# Altium schematic sheet Connector_Section.SchDoc
size A4; DocumentNumber: 7; SheetNumber: 7; SheetTotal: 7
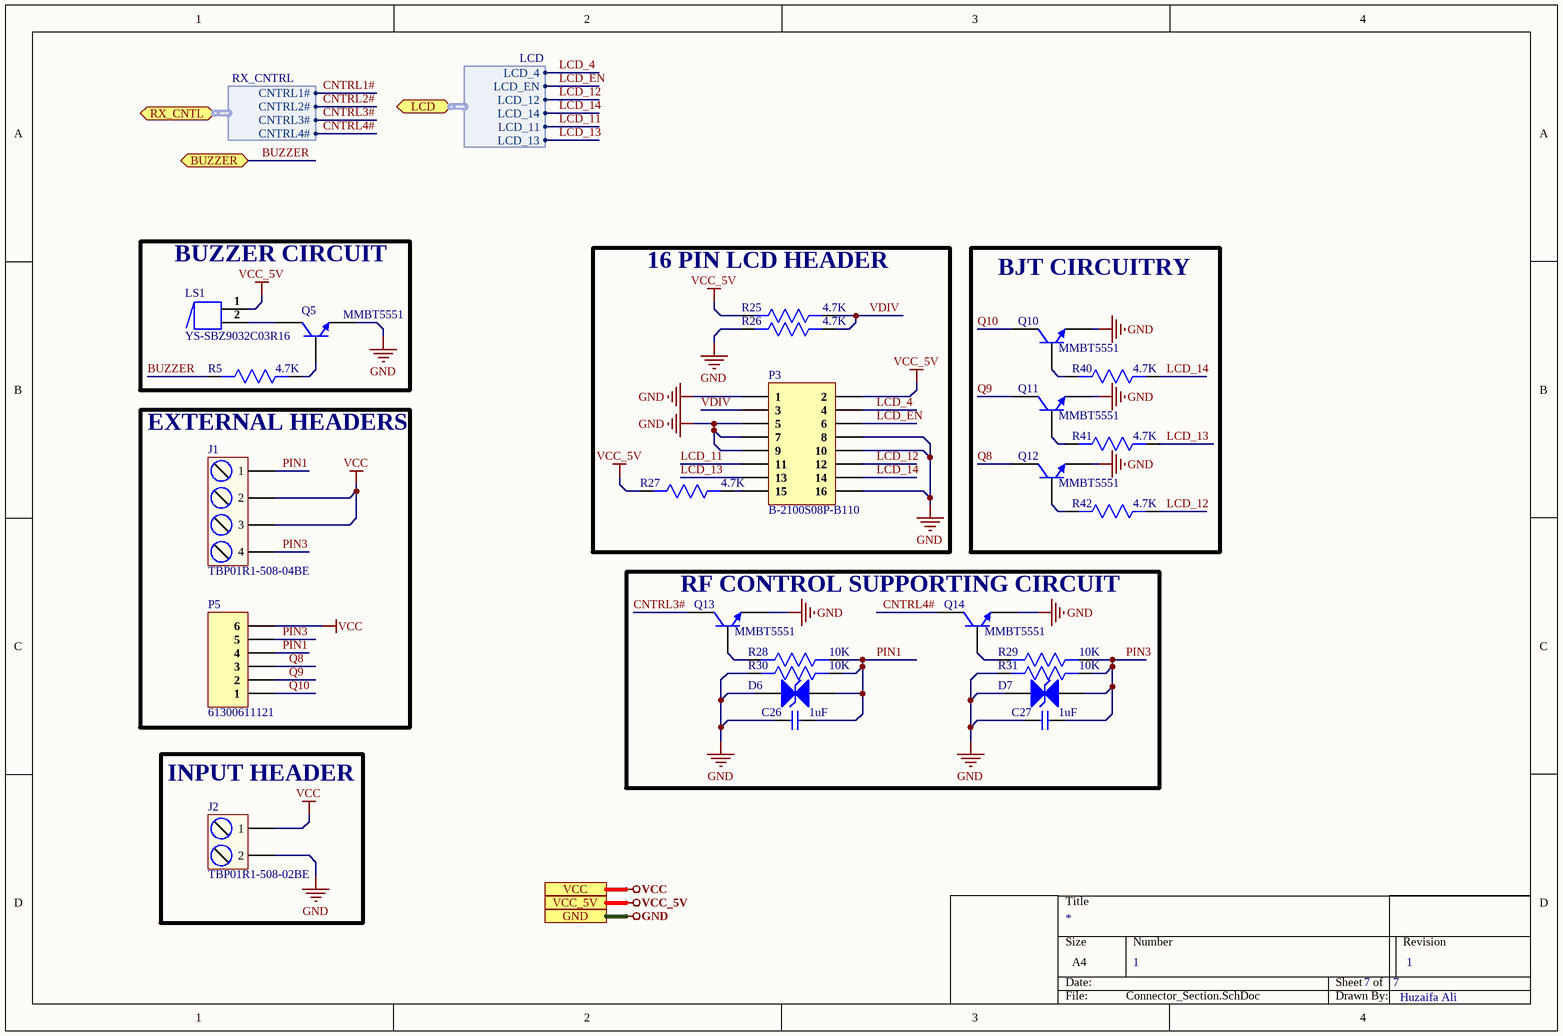
[diagram p0: Connector_Section.SchDoc]

## Parts
C26  1uF  [Cap0603]
C27  1uF  [Cap0603]
D6  SMAJ5.0CA  [SMA]  (value not drawn)
D7  SMAJ5.0CA  [SMA]  (value not drawn)
J1  TBP01R1-508-04BE  [TBP01R1-508-04BE]
J2  TBP01R1-508-02BE  [TBP01R1-508-02BE]
LS1  YS-SBZ9032C03R16  [YS-SBZ9032C03R16]
P3  B-2100S08P-B110  [B-2100S08P-B110]
P5  61300611121  [HDR1X6]
Q5  MMBT5551  [SOT23-3]
Q10  MMBT5551  [SOT23-3]
Q11  MMBT5551  [SOT23-3]
Q12  MMBT5551  [SOT23-3]
Q13  MMBT5551  [SOT23-3]
Q14  MMBT5551  [SOT23-3]
R5  4.7K  [Res-0603]
R25  4.7K  [Res0603]
R26  4.7K  [Res0603]
R27  4.7K  [Res0603]
R28  10K  [Res0603]
R29  10K  [Res0603]
R30  10K  [Res0603]
R31  10K  [Res0603]
R40  4.7K  [Res0603]
R41  4.7K  [Res0603]
R42  4.7K  [Res0603]

## Blocks framed on the sheet
BUZZER CIRCUIT: LS1 Q5 R5
16 PIN LCD HEADER: P3 R25-R27
BJT CIRCUITRY: Q10-Q12 R40-R42
EXTERNAL HEADERS: J1 P5
RF CONTROL SUPPORTING CIRCUIT: C26 C27 D6 D7 Q13 Q14 R28-R31
INPUT HEADER: J2

## Ports
BUZZER (bidir), GND, LCD (bidir, harness LCD), RX_CNTL (bidir, harness RX_CNTRL), VCC, VCC_5V

## Harnesses
RX_CNTRL: CNTRL1#, CNTRL2#, CNTRL3#, CNTRL4#
LCD: LCD_4, LCD_EN, LCD_12, LCD_14, LCD_11, LCD_13

## Nets
GND: C26.1 C27.1 D6.1(A) D7.1(A) J2.2 P3.1 P3.5 P3.7 P3.8 P3.9 P3.10 P3.16 Q5.2(E) Q10.2(E) Q11.2(E) Q12.2(E) Q13.2(E) Q14.2(E) R26.2 R30.2 R31.2 ; port GND
VCC: J1.2 J1.3 J2.1 P5.6 ; port VCC
VCC_5V: LS1.1 P3.2 R25.2 R27.2 ; port VCC_5V
BUZZER: R5.2 ; port BUZZER
CNTRL1#: port RX_CNTL.CNTRL1#
CNTRL2#: port RX_CNTL.CNTRL2#
CNTRL3#: Q13.3(C) ; port RX_CNTL.CNTRL3#
CNTRL4#: Q14.3(C) ; port RX_CNTL.CNTRL4#
LCD_4: P3.4 ; port LCD.LCD_4
LCD_11: P3.11 ; port LCD.LCD_11
LCD_12: P3.12 R42.1 ; port LCD.LCD_12
LCD_13: P3.13 R41.1 ; port LCD.LCD_13
LCD_14: P3.14 R40.1 ; port LCD.LCD_14
LCD_EN: P3.6 ; port LCD.LCD_EN
PIN1: C26.2 D6.2(A) J1.1 P5.4 R28.1 R30.1
PIN3: C27.2 D7.2(A) J1.4 P5.5 R29.1 R31.1
Q8: P5.3 Q12.3(C)
Q9: P5.2 Q11.3(C)
Q10: P5.1 Q10.3(C)
VDIV: P3.3 R25.1 R26.1
NetLS1_2: LS1.2 Q5.3(C)
NetP3_15: P3.15 R27.1
NetQ5_1: Q5.1(B) R5.1
NetQ10_1: Q10.1(B) R40.2
NetQ11_1: Q11.1(B) R41.2
NetQ12_1: Q12.1(B) R42.2
NetQ13_1: Q13.1(B) R28.2
NetQ14_1: Q14.1(B) R29.2

## Notes on the sheet
- 1
- Huzaifa Ali

## Library data of the parts
C26 C27 = CL10A105KA8NNNC: CAP CER 1UF 25V X5R 0603; Manufacturer: Sams; Tolerance: 10%; Supplier 1: Digi-Key; Manufacturer Part Number: CL10A105KA8NNNC; Stock 1: 2768758; Pricing 1: 1=0.1, 10=0.036, 50=0.0198, 100=0.0161, 500=0.01152, 1000=0.00904 (USD); Mount: Surface Mount; Case/Package: 0603; Min Operating Temperature: -55°C; Max Operating Temperature: 85°C; Capacitance: 1uF; Dielectric: X5R; Voltage Rating (DC): 25V; Voltage: 25V; Length: 1.6mm; Height: 0.8mm; Depth: 0.8mm; Lead Free: Lead Free; Supplier Part Number 1: 1276-1102-1-ND
D6 D7 = SMAJ5.0CA: 43.5A 9.2V 6.4V 5V Bi-Directional SMA(DO-214AC) TVS ROHS; Manufacturer: Bourns; Breakdown Voltage: 7V; Polarity: Bidirectional; Peak Pulse Power: 400W; Test Current: 10mA; Element Configuration: Single; Max Surge Current: 40A; Max Reverse Leakage Current: 1.6mA; Number of Channels: 1; Power Line Protection: No; Diode Type: ZENER; ESD Protection: Yes; Supplier 1: RSComponents; Manufacturer Part Number: SMAJ5.0CA; RoHS: Yes; Category: TVS Diodes; Stock 1: 4825; Pricing 1: 5000=0.16400, 10000=0.16000, 15000=0.15600 (GBP); Mount: Surface Mount; Case/Package: DO-214AC; Number of Pins: 2; Contact Plating: Tin; Min Operating Temperature: -55°C; Max Operating Temperature: 150°C; Reverse Standoff Voltage: 5V; Clamping Voltage: 9.2V; Direction: Bidirectional; Packaging: Tape and Reel; Min Breakdown Voltage: 6.4V; Peak Pulse Current: 43.5A; Package Quantity: 1; Operating Supply Voltage: 5V; Max Power Dissipation: 400W; Termination: SMD/SMT; Reverse Breakdown Voltage: 6.4V; Max Breakdown Voltage: 7V; Number of Elements: 1; Leakage Current: 1.6mA; Number of Bidirectional Channels: 1; Resistor Type: Zener; Series: SMAJ; Radiation Hardening: No; RoHS Compliant: Yes; REACH SVHC: No SVHC; ComponentLink1URL: https://datasheet.ciiva.com/11336/smaj-11336795.pdf?src-supplier=Avnet; ComponentLink1Description: https://datasheet.ciiva.com/11336/smaj-11336795.pdf?src-supplier=Avnet; ComponentLink2URL: https://datasheet.ciiva.com/3022/smaj-3022286.pdf?src-supplier=Avnet; ComponentLink2Description: https://datasheet.ciiva.com/3022/smaj-3022286.pdf?src-supplier=Avnet; ComponentLink3URL: https://datasheet.ciiva.com/334/smaj-334523.pdf?src-supplier=Digi-Key; ComponentLink3Description: https://datasheet.ciiva.com/334/smaj-334523.pdf?src-supplier=Digi-Key; ComponentLink4URL: https://datasheet.ciiva.com/334/smaj-334524.pdf?src-supplier=Digi-Key; ComponentLink4Description: https://datasheet.ciiva.com/334/smaj-334524.pdf?src-supplier=Digi-Key; ComponentLink5URL: https://datasheet.ciiva.com/334/smaj-334522.pdf?src-supplier=Digi-Key; ComponentLink5Description: https://datasheet.ciiva.com/334/smaj-334522.pdf?src-supplier=Digi-Key; ComponentLink6URL: https://datasheet.ciiva.com/30090/smaj-30090141.pdf?src-supplier=Onlinecomponents.com; ComponentLink6Description: https://datasheet.ciiva.com/30090/smaj-30090141.pdf?src-supplier=Onlinecomponents.com; ComponentLink7URL: https://datasheet.ciiva.com/17413/smaj-17413550.pdf?; ComponentLink7Description: https://datasheet.ciiva.com/17413/smaj-17413550.pdf?; Supplier Part Number 1: 1742481
J1 = TBP01R1-508-04BE: TERMINAL BLOCK, PLUGGABLE, 5.08,; Manufacturer: CUI Devices; Supplier 1: Arrow Electronics; Manufacturer Part Number: TBP01R1-508-04BE; RoHS: Yes; Category: Terminal Blocks; Stock 1: 697; Pricing 1: 1=0.77380, 10=0.29040, 25=0.28750, 50=0.25070, 200=0.24820, 400=0.24580, 600=0.22570 (USD); Supplier Part Number 1: TBP01R1-508-04BE
J2 = TBP01R1-508-02BE: TERMINAL BLOCK, PLUGGABLE, 5.08,; Manufacturer: CUI Devices; Supplier 1: Arrow Electronics; Manufacturer Part Number: TBP01R1-508-02BE; RoHS: Yes; Category: Terminal Blocks; Stock 1: 1821; Pricing 1: 1=0.57450, 10=0.23530, 25=0.18730, 50=0.17170, 100=0.16040, 400=0.14010, 800=0.12060, 1200=0.11290 (USD); Supplier Part Number 1: TBP01R1-508-02BE
LS1 = YS-SBZ9032C03R16: NO 2700Hz 85dB @ 3V, 10cm 3V Φ9mm SMD,9x3.2mm Buzzers RoHS; Manufacturer: Fengming; Operating Voltage: 2 ~ 4V; Package: SMD,9x3.2mm; Frequency - Self Resonant: 2700Hz; Rated Voltage: 3V
P3 = B-2100S08P-B110: Straight 2.54mm 6mm -40℃~+105℃ 2 3mm 8 2.54mm Black Brass 2x4P 2.54mm Plugin,P=2.54mm Pin Headers; Manufacturer: Ckmtw(Shenzhen Cankemeng); Mounting Type: Straight; Insulation Height: 2.54mm; Length of Mating Pin: 6mm; Operating Temperature Range: -40℃~+105℃; Number of Rows: 2; Length of End Connection Pin: 3mm
P5 = 61300611121: CONN HEADER 6 POS 2.54; Manufacturer: Wurth Electronics; Current Rating: 3A; Voltage Rating: 250V; Number of Positions: 6; Gender: Male; Connector Type: Male Pin; Pitch: 0.1inch; Supplier 1: Newark; Manufacturer Part Number: 61300611121; RoHS: Yes; Category: Headers and Wire Housings; Stock 1: 4996; Pricing 1: 1=0.34000, 10=0.28900, 25=0.24000, 50=0.20100, 100=0.18200 (USD); Mount: Through Hole; Contact Plating: Gold; Contact Material: Copper Alloy,Copper; Housing Material: PBT; Color: Black; Min Operating Temperature: -40°C; Max Operating Temperature: 125°C; Number of Rows: 1; Contact Gender: Male; Packaging: Bulk; Termination: Through Hole; Number of Contacts: 6; Series: WR-PHD; Contact Type: Male Pin; Contact Mating Length: 0.236inch; REACH SVHC: Unknown; Lead Free: Lead Free; RoHS Compliant: Yes; ComponentLink1URL: http://www.mouser.com/ds/2/445/6130xx11121-538006.pdf?src-supplier=Mouser; ComponentLink1Description: http://www.mouser.com/ds/2/445/6130xx11121-538006.pdf?src-supplier=Mouser; ComponentLink2URL: http://www.farnell.com/cad/1737268.pdf?src-supplier=Element14; ComponentLink2Description: http://www.farnell.com/cad/1737268.pdf?src-supplier=Element14; ComponentLink3URL: https://katalog.we-online.de/em/datasheet/6130xx11121.pdf?src-supplier=Digi-Key; ComponentLink3Description: https://katalog.we-online.de/em/datasheet/6130xx11121.pdf?src-supplier=Digi-Key; Supplier Part Number 1: 20X0957
Q5 Q10-Q14 = MMBT5551: TRANS NPN 160V 0.6A SOT23; Manufacturer: ON Semiconductor; Manufacturer Part Number: MMBT5551LT1G; Max Power Dissipation: 225mW; Max Collector Current: 600mA; Collector Base Voltage (VCBO): 180V; Emitter Base Voltage (VEBO): 6V; Element Configuration: Single; Number of Elements: 1; hFE Min: 80; Power Dissipation: 300mW; Collector Emitter Saturation Voltage: 150mV; Collector-emitter Voltage-Max: 200mV; Supplier 1: Newark; RoHS: Yes; Category: BJTs; Stock 1: 100073; Pricing 1: 1=0.20900, 5=0.20900, 10=0.15200, 100=0.08400, 500=0.06700 (USD); Case/Package: SOT-23-3; Number of Pins: 3; Weight: 0.01lb; Contact Plating: Tin,Matte; Min Operating Temperature: -55°C; Max Operating Temperature: 150°C; Collector Emitter Voltage (VCEO): 160V; Packaging: Tape and Reel; Collector Emitter Breakdown Voltage: 160V; Polarity: NPN; Package Quantity: 1; Max Breakdown Voltage: 160V; Voltage Rating (DC): 160V; Current Rating: 600mA; Series: -; Length: 2.9mm; Width: 1.3mm; Height: 0.94mm; Radiation Hardening: No; Lead Free: Lead Free; RoHS Compliant: Yes; REACH SVHC: No SVHC; ComponentLink1URL: https://datasheet.ciiva.com/34303/2011387-34303825.pdf?src-supplier=Jameco; ComponentLink1Description: https://datasheet.ciiva.com/34303/2011387-34303825.pdf?src-supplier=Jameco; ComponentLink2URL: https://datasheet.ciiva.com/15139/getdatasheetpartid-92641-15139178.pdf?src-supplier=Verical; ComponentLink2Description: https://datasheet.ciiva.com/15139/getdatasheetpartid-92641-15139178.pdf?src-supplier=Verical; ComponentLink3URL: https://datasheet.ciiva.com/976/mmbt5550lt1-d-976512.pdf?src-supplier=Digi-Key; ComponentLink3Description: https://datasheet.ciiva.com/976/mmbt5550lt1-d-976512.pdf?src-supplier=Digi-Key; ComponentLink4URL: https://datasheet.ciiva.com/16984/0900766b8078eb1b-16984971.pdf?src-supplier=Allied+Electronics; ComponentLink4Description: https://datasheet.ciiva.com/16984/0900766b8078eb1b-16984971.pdf?src-supplier=Allied+Electronics; ComponentLink5URL: https://datasheet.ciiva.com/7972/mmbt5550lt1-d-7972073.pdf?src-supplier=Element14; ComponentLink5Description: https://datasheet.ciiva.com/7972/mmbt5550lt1-d-7972073.pdf?src-supplier=Element14; ComponentLink6URL: https://datasheet.ciiva.com/7972/mmbt5550lt1-d-7972075.pdf?src-supplier=Element14; ComponentLink6Description: https://datasheet.ciiva.com/7972/mmbt5550lt1-d-7972075.pdf?src-supplier=Element14; ComponentLink7URL: https://datasheet.ciiva.com/4722/mmbt5550lt1-d-111393-4722711.pdf?src-supplier=Mouser; ComponentLink7Description: https://datasheet.ciiva.com/4722/mmbt5550lt1-d-111393-4722711.pdf?src-supplier=Mouser; ComponentLink8URL: https://datasheet.ciiva.com/11197/mmbt5550lt1-d-11197404.pdf?src-supplier=Avnet; ComponentLink8Description: https://datasheet.ciiva.com/11197/mmbt5550lt1-d-11197404.pdf?src-supplier=Avnet; ComponentLink9URL: https://datasheet.ciiva.com/16342/mmbt5550lt1-d-16342687.pdf?src-supplier=Future+Electronics; ComponentLink9Description: https://datasheet.ciiva.com/16342/mmbt5550lt1-d-16342687.pdf?src-supplier=Future+Electronics; ComponentLink10URL: https://datasheet.ciiva.com/976/mmbt5550lt1-d-976513.pdf?src-supplier=Digi-Key; ComponentLink10Description: https://datasheet.ciiva.com/976/mmbt5550lt1-d-976513.pdf?src-supplier=Digi-Key; ComponentLink11URL: https://datasheet.ciiva.com/976/mmbt5550lt1-d-976511.pdf?src-supplier=Digi-Key; ComponentLink11Description: https://datasheet.ciiva.com/976/mmbt5550lt1-d-976511.pdf?src-supplier=Digi-Key; Supplier Part Number 1: 58M9157
R5 = RC0603JR-074K7L: RES SMD 4.7K OHM 5% 1/10W 0603; Manufacturer: Yageo; Resistance: 4.7kR; Temperature Coefficient: 100ppm/°C; Voltage Rating (DC): 50V; Power Rating: 100mW; Supplier 1: Digi-Key; Manufacturer Part Number: RC0603JR-074K7L; Stock 1: 19706643; Pricing 1: 1=0.1, 10=0.02, 100=0.0081, 1000=0.00362, 2500=0.00314 (USD); Case/Package: 0603; Number of Pins: 2; Case Code (Imperial): 0603; Case Code (Metric): 1608; Min Operating Temperature: -55°C; Max Operating Temperature: 155°C; Tolerance: 5%; Composition: Thick Film; Packaging: Tape and Reel; Voltage Rating: 50V; Termination: SMD/SMT; Military Standard: Not; Length: 1.6mm; Width: 0.8mm; Depth: 0.8mm; REACH SVHC: No SVHC; Lead Free: Lead Free; ComponentLink1URL: http://www.farnell.com/datasheets/443971.pdf?src-supplier=Element14; ComponentLink1Description: http://www.farnell.com/datasheets/443971.pdf?src-supplier=Element14; Supplier Part Number 1: 311-4.7KGRCT-ND; LCSC Part Number: C105428
R25-R27 R40-R42 = AT0603BRD074K7L: RES SMD 4.7K OHM 0.1% 1/10W 0603; Manufacturer: Yageo; Resistance: 4.7kR; Max Power Dissipation: 100mW; Temperature Coefficient: 25ppm/°C; Supplier 1: Digi-Key; Manufacturer Part Number: AT0603BRD074K7L; Stock 1: 7928; Pricing 1: 1=0.56, 10=0.431, 100=0.181, 1000=0.09986, 2500=0.09362 (USD); Case/Package: 0603; Case Code (Metric): 1608; Case Code (Imperial): 0603; Min Operating Temperature: -55°C; Max Operating Temperature: 155°C; Packaging: Tape and Reel; Composition: Thin Film; Number of Terminations: 2; Tolerance: 0.1%; Features: Anti-Sulfur,Automotive AEC-Q200,Moisture Resistant; Length: 0.063inch; Height: 0.022inch; Width: 0.032inch; Supplier Part Number 1: YAG2113CT-ND
R28-R31 = AC0603JR-0710KL: RES SMD 10K OHM 5% 1/10W 0603; Manufacturer: Yageo; Voltage Rating: 50V; Resistance: 10kR; Power Rating: 100mW; Temperature Coefficient: 100ppm/°C; Supplier 1: Future Electronics; Manufacturer Part Number: AC0603JR-0710KL; RoHS: Yes; Category: Chip SMD Resistors; Stock 1: 1533000; Pricing 1: 5000=0.00540 (USD); Case/Package: 0603; Case Code (Imperial): 0603; Case Code (Metric): 1608; Size Code: 0603; Min Operating Temperature: -55°C; Max Operating Temperature: 155°C; Packaging: Tape and Reel; Tolerance: 5%; Package Quantity: 1; Resistor Type: Thick Film; Termination: SMD/SMT; Number of Terminations: 2; Max Power Dissipation: 100mW; Features: Moisture Resistant,Automotive AEC-Q200,Anti-Sulfur; Series: AC; Construction: Rectangular; Length: 0.063inch; Width: 0.031inch; Height: 0.022inch; Depth: 0.8mm; Military Standard: Not; Lead Free: Lead Free; RoHS Compliant: Yes; ComponentLink1URL: https://datasheet.ciiva.com/5562/pyu-ac-51-rohs-l-2-5562553.pdf?src-supplier=Mouser; ComponentLink1Description: https://datasheet.ciiva.com/5562/pyu-ac-51-rohs-l-2-5562553.pdf?src-supplier=Mouser; Supplier Part Number 1: 1029044